# Altium schematic sheet mcu.SchDoc
size A4; SPICEModelCacheXRGICAAV: <root> / <DocumentId>XRGICAAV</DocumentId> / </root>
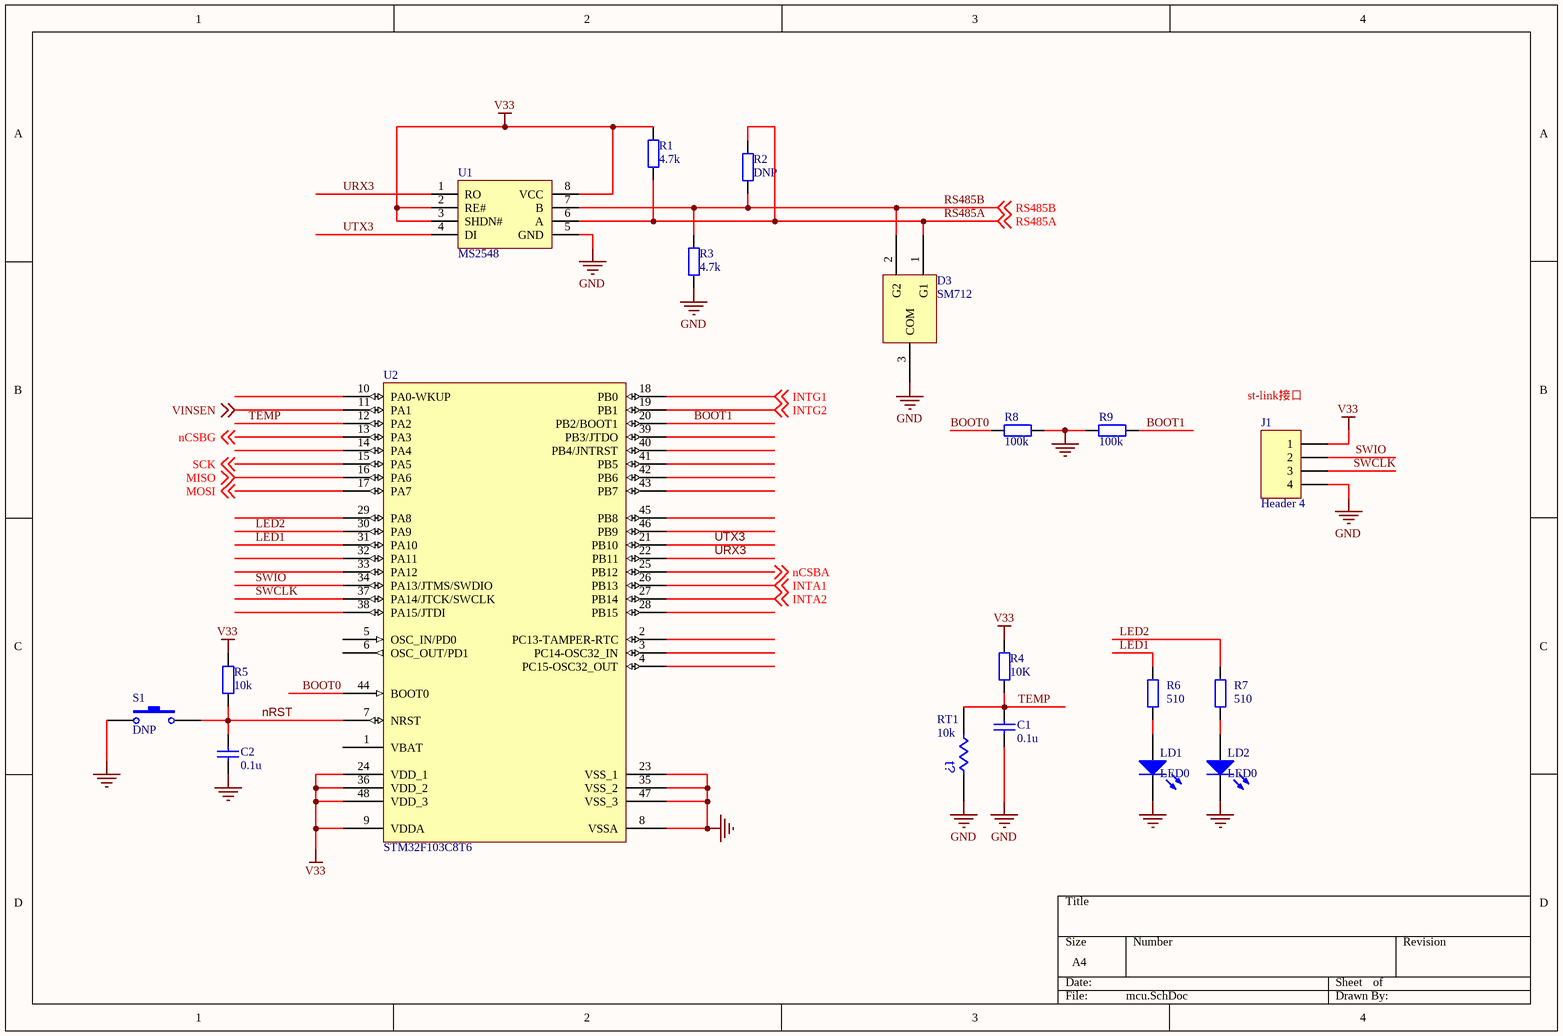
[diagram p0: mcu.SchDoc]

## Parts
C1  value 0.1u  [0603C]  (hidden comment: Cap)
C2  value 0.1u  [0603C]  (hidden comment: Cap)
D3  SM712  [sot-23]
J1  Header 4  [xhb127-4]
LD1  LED0  [0603d-s]
LD2  LED0  [0603d-s]
R1  value 4.7k  [0603R]  (hidden comment: Res2)
R2  value DNP  [0603R]  (hidden comment: Res2)
R3  value 4.7k  [0603R]  (hidden comment: Res2)
R4  value 10K  [0603R]  (hidden comment: Res2)
R5  value 10k  [0603R]  (hidden comment: Res2)
R6  value 510  [0603R]  (hidden comment: Res2)
R7  value 510  [0603R]  (hidden comment: Res2)
R8  value 100k  [0603R]  (hidden comment: Res2)
R9  value 100k  [0603R]  (hidden comment: Res2)
RT1  10k  [0603R]
S1  DNP  [0603R]
U1  MS2548  [SOIC127P600-8AM]
U2  STM32F103C8T6  [TSQFP50P900X900-48M]

## Nets
GND: C1.1 C2.1 D3.3(COM) J1.4 LD1.2(K) LD2.2(K) R3.1 R8.2 R9.1 RT1.1 S1.1 U1.5(GND) U2.8(VSSA) U2.23(VSS_1) U2.35(VSS_2) U2.47(VSS_3)
V33: J1.1 R1.1 R4.1 R5.2 U1.2(RE#) U1.3(SHDN#) U1.8(VCC) U2.9(VDDA) U2.24(VDD_1) U2.36(VDD_2) U2.48(VDD_3)
BOOT0: R8.1 U2.44(BOOT0)
BOOT1: R9.2 U2.20(PB2/BOOT1)
INTA1: U2.26(PB13) ; off-sheet INTA1
INTA2: U2.27(PB14) ; off-sheet INTA2
INTG1: U2.18(PB0) ; off-sheet INTG1
INTG2: U2.19(PB1) ; off-sheet INTG2
LED1: R6.2 U2.31(PA10)
LED2: R7.2 U2.30(PA9)
MISO: U2.16(PA6) ; off-sheet MISO
MOSI: U2.17(PA7) ; off-sheet MOSI
nCSBA: U2.25(PB12) ; off-sheet nCSBA
nCSBG: U2.13(PA3) ; off-sheet nCSBG
nRST: C2.2 R5.1 S1.2 U2.7(NRST)
RS485A: D3.1(G1) R1.2 R2.2 U1.6(A) ; off-sheet RS485A
RS485B: D3.2(G2) R2.1 R3.2 U1.7(B) ; off-sheet RS485B
SCK: U2.15(PA5) ; off-sheet SCK
SWCLK: J1.3 U2.37(PA14/JTCK/SWCLK)
SWIO: J1.2 U2.34(PA13/JTMS/SWDIO)
TEMP: C1.2 R4.2 RT1.2 U2.12(PA2)
URX3: U1.1(RO) U2.22(PB11)
UTX3: U1.4(DI) U2.21(PB10)
VINSEN: U2.11(PA1) ; off-sheet VINSEN
NetLD1_1: LD1.1(A) R6.1
NetLD2_1: LD2.1(A) R7.1

Not connected (* = marked no-connect by the designer): U2 1(VBAT) 2(PC13-TAMPER-RTC) 3(PC14-OSC32_IN) 4(PC15-OSC32_OUT) 5(OSC_IN/PD0) 6(OSC_OUT/PD1) 10(PA0-WKUP) 14(PA4) 28(PB15) 29(PA8) 32(PA11) 33(PA12) 38(PA15/JTDI) 39(PB3/JTDO) 40(PB4/JNTRST) 41(PB5) 42(PB6) 43(PB7) 45(PB8) 46(PB9)

## Notes on the sheet
- (near J1) st-link接口
- (in symbol Res Thermal) t?

## Library data of the parts
C1 C2 = Cap: Capacitor; Published: 8-Jun-2000; LatestRevisionDate: 17-Jul-2002; LatestRevisionNote: Re-released for DXP Platform.; PackageReference: RAD-0.3; Publisher: Altium Limited; PackageDescription: Radial Cap, Thru-Hole; 2 Leads; 0.3 in Pin Spacing
D3 = SM712: 7V/12V TVS diodes
J1 = Header 4: Header, 4-Pin; LatestRevisionDate: 17-Jul-2002; LatestRevisionNote: Re-released for DXP Platform.; Publisher: Altium Limited
LD1 LD2 = LED0: Typical INFRARED GaAs LED; Published: 8-Jun-2000; LatestRevisionDate: 08-Jul-2005; LatestRevisionNote: Mech Layer 1 removed.; PackageReference: LED-0; Publisher: Altium Limited; PackageDescription: LED; 2 Leads
R1-R9 = Res2: Resistor; Published: 8-Jun-2000; LatestRevisionDate: 17-Jul-2002; LatestRevisionNote: Re-released for DXP Platform.; PackageReference: AXIAL-0.4; Publisher: Altium Limited; PackageDescription: Axial Device, Thru-Hole; 2 Leads; 0.4 in Pin Spacing
RT1 = Res Thermal: Thermistor; Published: 24-Mar-1999; LatestRevisionDate: 29-May-2009; LatestRevisionNote: IPC-7351 Footprint Added.; PackageVersion: Mar-2003; PackageReference: 6-0805; Publisher: Altium Limited; PackageDescription: Chip Resistor 0805 Case Size; Code_IPC: RESC2012
S1 = SW-PB: Switch; Published: 24-Mar-1999; LatestRevisionDate: 17-Jul-2002; LatestRevisionNote: Re-released for DXP Platform.; PackageReference: SPST-2; Publisher: Altium Limited; PackageDescription: Switch; 2 Leads
U1 = MAX13487
U2 = STM32F101C8T6: STM32 ARM-based 32-bit MCU with 64 Kbytes Flash, 48-pin LQFP, Industrial Temperature; Published: 30-May-2008; DatasheetVersion: rev6, Mar-2008; PackageVersion: Mar-2008; PackageReference: LQFP48; Publisher: Altium Limited; PackageDescription: 48-Pin Low-Profile Quad Flat Pack, 7 x 7 mm Body, 0.5 mm Pitch (LQFP48); ComponentLink1Description: Manufacturer Link; ComponentLink1URL: www.st.com/stm32; ComponentLink2Description: Datasheet; ComponentLink2URL: http://www.st.com/stonline/products/literature/ds/13586.pdf